# Altium project CountsFitness.PrjPCB (part 1 of 3)
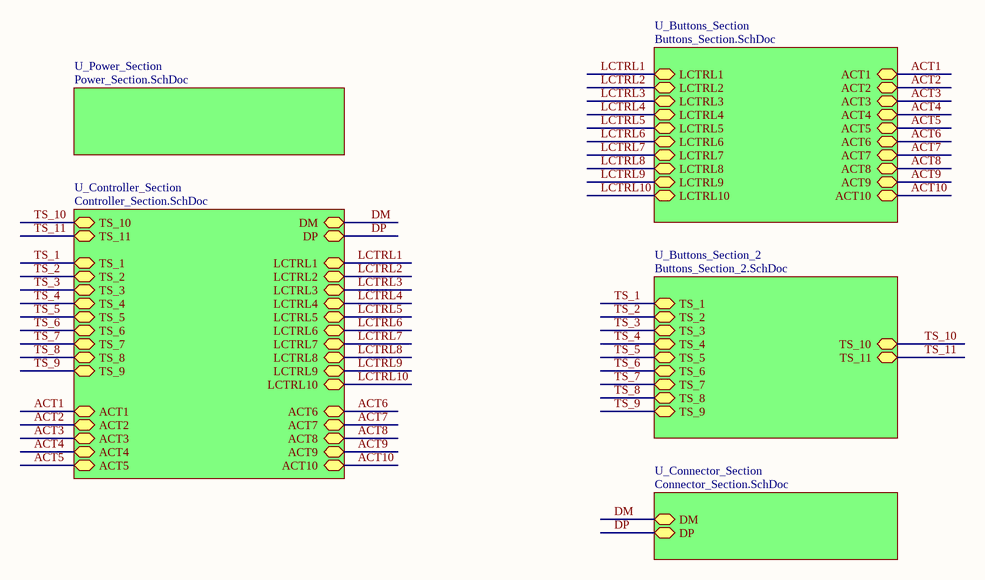
[diagram p0: Top Sheet.SchDoc]
6 sheets, 174 parts. Net scope: hierarchical (ports join the sheet entries above them; power ports are global).
Board file: Counts_PCB.PcbDoc
Sheets:
  Top Sheet.SchDoc
    U_Power_Section = Power_Section.SchDoc
    U_Controller_Section = Controller_Section.SchDoc
    U_Buttons_Section = Buttons_Section.SchDoc
    U_Connector_Section = Connector_Section.SchDoc
    U_Buttons_Section_2 = Buttons_Section_2.SchDoc

## Sheet Top Sheet.SchDoc
size A4; DocumentNumber: 1; SheetNumber: 1; SheetTotal: 6

### Sub-sheets
U_Buttons_Section = Buttons_Section.SchDoc: ACT9 (bidir), LCTRL8 (bidir), ACT4 (bidir), ACT3 (bidir), LCTRL5 (bidir), ACT2 (bidir), LCTRL4 (bidir), LCTRL7 (bidir), ACT6 (bidir), LCTRL2 (bidir), LCTRL6 (bidir), LCTRL9 (bidir), ACT1 (bidir), ACT8 (bidir), ACT7 (bidir), ACT10 (bidir), ACT5 (bidir), LCTRL3 (bidir), LCTRL1 (bidir), LCTRL10 (bidir)
U_Buttons_Section_2 = Buttons_Section_2.SchDoc: TS_6 (bidir), TS_8 (bidir), TS_9 (bidir), TS_5 (bidir), TS_2 (bidir), TS_7 (bidir), TS_4 (bidir), TS_1 (bidir), TS_3 (bidir), TS_10 (bidir), TS_11 (bidir)
U_Connector_Section = Connector_Section.SchDoc: DM (bidir), DP (bidir)
U_Controller_Section = Controller_Section.SchDoc: ACT6 (bidir), LCTRL5 (bidir), ACT10 (bidir), LCTRL1 (bidir), ACT8 (bidir), LCTRL4 (bidir), ACT5 (bidir), ACT9 (bidir), ACT1 (bidir), LCTRL2 (bidir), LCTRL6 (bidir), ACT3 (bidir), ACT2 (bidir), LCTRL3 (bidir), ACT4 (bidir), DM (bidir), DP (bidir), ACT7 (bidir), LCTRL7 (bidir), LCTRL10 (bidir), LCTRL9 (bidir), LCTRL8 (bidir), TS_8 (bidir), TS_7 (bidir), TS_9 (bidir), TS_6 (bidir), TS_5 (bidir), TS_4 (bidir), TS_3 (bidir), TS_2 (bidir), TS_1 (bidir), TS_10 (bidir), TS_11 (bidir)
U_Power_Section = Power_Section.SchDoc: no entries

### Nets
ACT1: sheet U_Controller_Section/ACT1, sheet U_Buttons_Section/ACT1
ACT2: sheet U_Controller_Section/ACT2, sheet U_Buttons_Section/ACT2
ACT3: sheet U_Controller_Section/ACT3, sheet U_Buttons_Section/ACT3
ACT4: sheet U_Controller_Section/ACT4, sheet U_Buttons_Section/ACT4
ACT5: sheet U_Controller_Section/ACT5, sheet U_Buttons_Section/ACT5
ACT6: sheet U_Controller_Section/ACT6, sheet U_Buttons_Section/ACT6
ACT7: sheet U_Controller_Section/ACT7, sheet U_Buttons_Section/ACT7
ACT8: sheet U_Controller_Section/ACT8, sheet U_Buttons_Section/ACT8
ACT9: sheet U_Controller_Section/ACT9, sheet U_Buttons_Section/ACT9
ACT10: sheet U_Controller_Section/ACT10, sheet U_Buttons_Section/ACT10
DM: sheet U_Controller_Section/DM, sheet U_Connector_Section/DM
DP: sheet U_Controller_Section/DP, sheet U_Connector_Section/DP
LCTRL1: sheet U_Controller_Section/LCTRL1, sheet U_Buttons_Section/LCTRL1
LCTRL2: sheet U_Controller_Section/LCTRL2, sheet U_Buttons_Section/LCTRL2
LCTRL3: sheet U_Controller_Section/LCTRL3, sheet U_Buttons_Section/LCTRL3
LCTRL4: sheet U_Controller_Section/LCTRL4, sheet U_Buttons_Section/LCTRL4
LCTRL5: sheet U_Controller_Section/LCTRL5, sheet U_Buttons_Section/LCTRL5
LCTRL6: sheet U_Controller_Section/LCTRL6, sheet U_Buttons_Section/LCTRL6
LCTRL7: sheet U_Controller_Section/LCTRL7, sheet U_Buttons_Section/LCTRL7
LCTRL8: sheet U_Controller_Section/LCTRL8, sheet U_Buttons_Section/LCTRL8
LCTRL9: sheet U_Controller_Section/LCTRL9, sheet U_Buttons_Section/LCTRL9
LCTRL10: sheet U_Controller_Section/LCTRL10, sheet U_Buttons_Section/LCTRL10
TS_1: sheet U_Controller_Section/TS_1, sheet U_Buttons_Section_2/TS_1
TS_2: sheet U_Controller_Section/TS_2, sheet U_Buttons_Section_2/TS_2
TS_3: sheet U_Controller_Section/TS_3, sheet U_Buttons_Section_2/TS_3
TS_4: sheet U_Controller_Section/TS_4, sheet U_Buttons_Section_2/TS_4
TS_5: sheet U_Controller_Section/TS_5, sheet U_Buttons_Section_2/TS_5
TS_6: sheet U_Controller_Section/TS_6, sheet U_Buttons_Section_2/TS_6
TS_7: sheet U_Controller_Section/TS_7, sheet U_Buttons_Section_2/TS_7
TS_8: sheet U_Controller_Section/TS_8, sheet U_Buttons_Section_2/TS_8
TS_9: sheet U_Controller_Section/TS_9, sheet U_Buttons_Section_2/TS_9
TS_10: sheet U_Controller_Section/TS_10, sheet U_Buttons_Section_2/TS_10
TS_11: sheet U_Controller_Section/TS_11, sheet U_Buttons_Section_2/TS_11

## Sheet Power_Section.SchDoc
size A4; DocumentNumber: 2; SheetNumber: 2; SheetTotal: 6
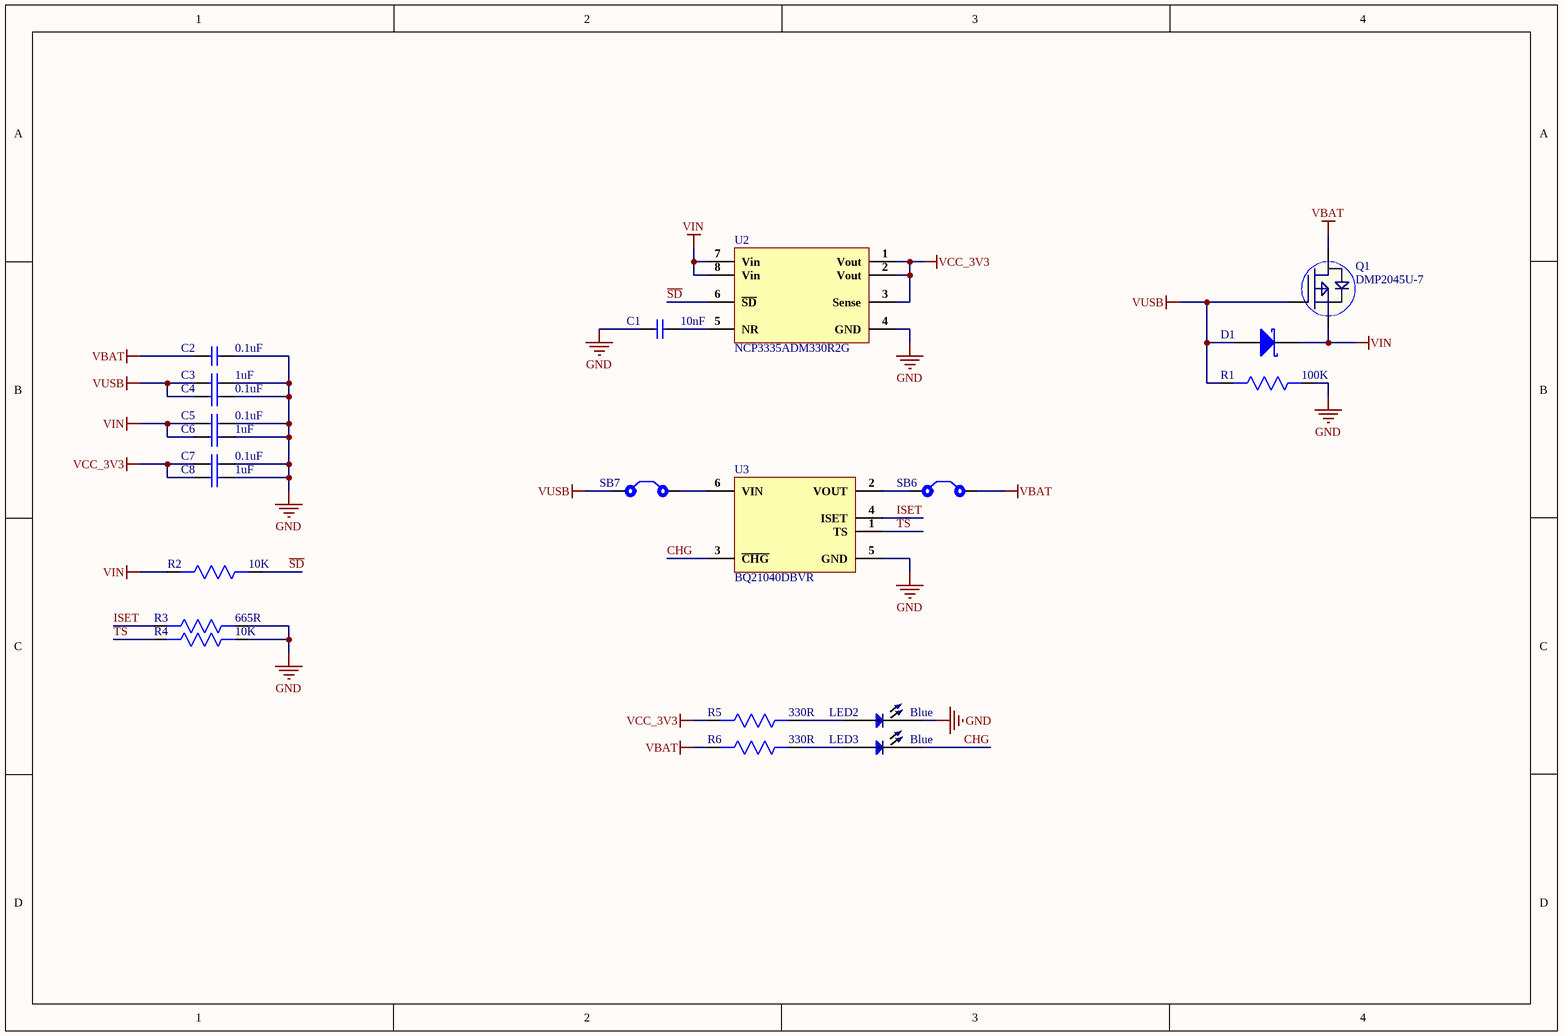
[diagram p1: Power_Section.SchDoc]

### Parts
C1  10nF  [Cap0402]
C2  0.1uF  [Cap0603]
C3  1uF  [Cap0603]
C4  0.1uF  [Cap0603]
C5  0.1uF  [Cap0402]
C6  1uF  [Cap0603]
C7  0.1uF  [Cap0402]
C8  1uF  [Cap0603]
D1  MBR120VLSFT3G  [MBR120VLSFT3G]  (value not drawn)
LED2  Blue  [LED 0603]
LED3  Blue  [LED 0603]
Q1  DMP2045U-7  [SOT23-3]
R1  100K  [Res0603]
R2  10K  [Res0402]
R3  665R  [Res0603]
R4  10K  [Res0402]
R5  330R  [Res0603]
R6  330R  [Res0603]
SB6  Solder Bridge  [Solder Bridge]  (value not drawn)
SB7  Solder Bridge  [Solder Bridge]  (value not drawn)
U2  NCP3335ADM330R2G  [NCP3335ADM330R2G]
U3  BQ21040DBVR  [BQ21040DBVR]

### Nets
GND: C1.1 C2.2 C3.2 C4.2 C5.2 C6.2 C7.2 C8.2 LED2.2 R1.1 R3.1 R4.1 U2.4(GND) U3.5(GND)
VBAT: C2.1 Q1.3(D) R6.2 SB6.2
VCC_3V3: C7.1 C8.1 R5.2 U2.1(Vout) U2.2(Vout) U2.3(Sense)
VIN: C5.1 C6.1 D1.2(K) Q1.2(S) R2.2 U2.7(Vin) U2.8(Vin)
VUSB: C3.1 C4.1 D1.1(A) Q1.1(G) R1.2 SB7.1
~{SD}: R2.1 U2.6(~{SD})
CHG: LED3.2 U3.3(~{CHG})
ISET: R3.2 U3.4(ISET)
TS: R4.2 U3.1(TS)
NetC1_2: C1.2 U2.5(NR)
NetLED2_1: LED2.1 R5.1
NetLED3_1: LED3.1 R6.1
NetSB6_1: SB6.1 U3.2(VOUT)
NetSB7_2: SB7.2 U3.6(VIN)

### Library data of the parts
C1 = CC0402KRX7R8BB103: CAP CER 10000PF 25V X7R 0402; Manufacturer: Yageo; Tolerance: 10%; Supplier 1: Digi-Key; Manufacturer Part Number: CC0402KRX7R8BB103; Stock 1: 0; Pricing 1: 1=0.1, 10=0.021, 100=0.0093, 500=0.00666, 1000=0.00523, 2500=0.00476, 5000=0.00438 (USD); Mount: Surface Mount; Case/Package: 0402; Case Code (Metric): 1005; Case Code (Imperial): 0402; Min Operating Temperature: -55°C; Max Operating Temperature: 125°C; Capacitance: 10nF; Dielectric: X7R; Voltage Rating: 25V; Package Quantity: 1; Packaging: Tape and Reel; Voltage Rating (DC): 25V; Termination: SMD/SMT; Composition: Ceramic; Length: 1mm; Height: 0.5mm; Depth: 0.5mm; Width: 0.02inch; Thickness: 0.022inch; Radiation Hardening: No; REACH SVHC: Unknown; Lead Free: Lead Free; Halogen Free: Halogen Free; ComponentLink1URL: http://www.yageo.com/documents/recent/UPY-GPHC_X7R_6.3V-to-50V_18.pdf?src-supplier=Digi-Key; ComponentLink1Description: http://www.yageo.com/documents/recent/UPY-GPHC_X7R_6.3V-to-50V_18.pdf?src-supplier=Digi-Key; ComponentLink2URL: https://www.verical.com/server-webapp/html/getDatasheet?partID=375418&src-supplier=Verical; ComponentLink2Description: https://www.verical.com/server-webapp/html/getDatasheet?partID=375418&src-supplier=Verical; ComponentLink3URL: http://www.yageo.com/documents/recent/UPY-GPHC_X7R_6.3V-to-50V_8.pdf?src-supplier=Avnet; ComponentLink3Description: http://www.yageo.com/documents/recent/UPY-GPHC_X7R_6.3V-to-50V_8.pdf?src-supplier=Avnet; ComponentLink4URL: https://4donline.ihs.com/images/VipMasterIC/IC/YAGO/YAGO-S-A0003557223/YAGO-S-A0003557223-1.pdf?hkey=52A5661711E402568146F3353EA87419&src-supplier=Element14; ComponentLink4Description: https://4donline.ihs.com/images/VipMasterIC/IC/YAGO/YAGO-S-A0003557223/YAGO-S-A0003557223-1.pdf?hkey=52A5661711E402568146F3353EA87419&src-supplier=Element14; ComponentLink5URL: http://www.farnell.com/datasheets/2167236.pdf?src-supplier=Element14; ComponentLink5Description: http://www.farnell.com/datasheets/2167236.pdf?src-supplier=Element14; ComponentLink6URL: http://www.mouser.com/ds/2/447/Yageo_UPY-GP_NP0_16V-to-50V_9-358835.pdf?src-supplier=Mouser; ComponentLink6Description: http://www.mouser.com/ds/2/447/Yageo_UPY-GP_NP0_16V-to-50V_9-358835.pdf?src-supplier=Mouser; Supplier Part Number 1: 311-1337-1-ND
C2 C4 = CC0603ZRY5V9BB104: CAP CER 0.1UF 50V Y5V 0603; Manufacturer: Yageo; Capacitance: 100nF; Tolerance: 80%; Supplier 1: Digi-Key; Manufacturer Part Number: CC0603ZRY5V9BB104; Stock 1: 15000880; Pricing 1: 1=0.1, 10=0.075, 100=0.0334, 500=0.02386, 1000=0.01874 (USD); Mount: Surface Mount; Case/Package: 0603; Number of Pins: 2; Case Code (Metric): 1608; Case Code (Imperial): 0603; Min Operating Temperature: -30°C; Max Operating Temperature: 85°C; Dielectric: Y5V; Voltage Rating: 50V; Package Quantity: 1; Packaging: Tape and Reel; Voltage Rating (DC): 50V; Termination: SMD/SMT; Composition: Ceramic; Voltage: 50V; Length: 1.6mm; Height: 0.8mm; Width: 0.031inch; Thickness: 0.035inch; Depth: 0.8mm; Radiation Hardening: No; REACH SVHC: No SVHC; Lead Free: Lead Free; Halogen Free: Halogen Free; ComponentLink1URL: http://www.yageo.com/documents/recent/UPY-GPHC_Y5V_6.3V-to-50V_8.pdf?src-supplier=Digi-Key; ComponentLink1Description: http://www.yageo.com/documents/recent/UPY-GPHC_Y5V_6.3V-to-50V_8.pdf?src-supplier=Digi-Key; ComponentLink2URL: http://www.yageo.com/documents/recent/UPY-GPHC_Y5V_6.3V-to-50V_5.pdf?src-supplier=Avnet+Europe; ComponentLink2Description: http://www.yageo.com/documents/recent/UPY-GPHC_Y5V_6.3V-to-50V_5.pdf?src-supplier=Avnet+Europe; ComponentLink3URL: https://www.verical.com/server-webapp/html/getDatasheet?partID=403611&src-supplier=Verical; ComponentLink3Description: https://www.verical.com/server-webapp/html/getDatasheet?partID=403611&src-supplier=Verical; ComponentLink4URL: http://www.mouser.com/ds/2/447/Yageo_UPY-GP_NP0_16V-to-50V_9-358835.pdf?src-supplier=Mouser; ComponentLink4Description: http://www.mouser.com/ds/2/447/Yageo_UPY-GP_NP0_16V-to-50V_9-358835.pdf?src-supplier=Mouser; ComponentLink5URL: http://www.farnell.com/datasheets/1132289.pdf?src-supplier=Element14; ComponentLink5Description: http://www.farnell.com/datasheets/1132289.pdf?src-supplier=Element14; Supplier Part Number 1: 311-1343-1-ND
C3 C6 C8 = UMK107AB7105KA-T: CAP CER 1UF 50V X7R 0603; Manufacturer: Taiyo Yuden; Tolerance: 10%; ComponentLink1URL: http://www.farnell.com/datasheets/2048165.pdf?src-supplier=Element14; ComponentLink1Description: http://www.farnell.com/datasheets/2048165.pdf?src-supplier=Element14; ComponentLink2URL: https://www.murata.com/~/media/webrenewal/support/library/catalog/products/capacitor/mlcc/c02e.ashx?la=en-us&src-supplier=Digi-Key; ComponentLink2Description: https://www.murata.com/~/media/webrenewal/support/library/catalog/products/capacitor/mlcc/c02e.ashx?la=en-us&src-supplier=Digi-Key; Supplier 1: Digi-Key; Manufacturer Part Number: UMK107AB7105KA-T; Stock 1: 453098; Pricing 1: 1=0.28, 10=0.19, 100=0.1079, 500=0.0762, 1000=0.0667 (USD); Mount: Surface Mount; Case/Package: 0603; Case Code (Metric): 1608; Case Code (Imperial): 0603; Min Operating Temperature: -55°C; Max Operating Temperature: 125°C; Packaging: Tape and Reel; Package Quantity: 1; Capacitance: 1uF; Voltage Rating: 50V; Voltage Rating (DC): 50V; Dielectric: X7R; Termination: SMD/SMT; Length: 1.6mm; Height: 0.8mm; Width: 0.031inch; Thickness: 0.037inch; Depth: 0.8mm; Radiation Hardening: No; Halogen Free: Halogen Free; ComponentLink3URL: https://www.yuden.co.jp/productdata/catalog/mlcc_all_e.pdf?src-supplier=Digi-Key; ComponentLink3Description: https://www.yuden.co.jp/productdata/catalog/mlcc_all_e.pdf?src-supplier=Digi-Key; ComponentLink4URL: https://www.yuden.co.jp/productdata/catalog/mlcc_all_e.pdf?src-supplier=Onlinecomponents.com; ComponentLink4Description: https://www.yuden.co.jp/productdata/catalog/mlcc_all_e.pdf?src-supplier=Onlinecomponents.com; Supplier Part Number 1: 587-3247-1-ND
C5 C7 = CC0402KRX7R7BB104: CAP CER 0.1UF 16V X7R 0402; Manufacturer: Yageo; Tolerance: 10%; Capacitance: 100nF; Supplier 1: Digi-Key; Manufacturer Part Number: CC0402KRX7R7BB104; Stock 1: 16982736; Pricing 1: 1=0.1, 10=0.034, 100=0.015, 500=0.0107, 1000=0.00841, 2500=0.00764, 5000=0.00703 (USD); Mount: Surface Mount; Case/Package: 0402; Number of Pins: 2; Case Code (Metric): 1005; Case Code (Imperial): 0402; Min Operating Temperature: -55°C; Max Operating Temperature: 125°C; Dielectric: X7R; Voltage Rating: 16V; Voltage Rating (DC): 16V; Packaging: Tape and Reel; Package Quantity: 1; Termination: SMD/SMT; Composition: Ceramic; Voltage: 16V; Length: 1mm; Height: 0.5mm; Width: 0.02inch; Thickness: 0.022inch; Depth: 0.5mm; Radiation Hardening: No; REACH SVHC: No SVHC; Lead Free: Lead Free; Halogen Free: Halogen Free; ComponentLink1URL: http://www.yageo.com/documents/recent/UPY-GPHC_X7R_6.3V-to-50V_8.pdf?src-supplier=Avnet+Europe; ComponentLink1Description: http://www.yageo.com/documents/recent/UPY-GPHC_X7R_6.3V-to-50V_8.pdf?src-supplier=Avnet+Europe; ComponentLink2URL: http://www.yageo.com/documents/recent/UPY-GPHC_X7R_6.3V-to-50V_18.pdf?src-supplier=Digi-Key; ComponentLink2Description: http://www.yageo.com/documents/recent/UPY-GPHC_X7R_6.3V-to-50V_18.pdf?src-supplier=Digi-Key; ComponentLink3URL: http://www.yageo.com/documents/recent/UPY-GPHC_X7R_6.3V-to-50V_8.pdf?src-supplier=Avnet; ComponentLink3Description: http://www.yageo.com/documents/recent/UPY-GPHC_X7R_6.3V-to-50V_8.pdf?src-supplier=Avnet; ComponentLink4URL: http://www.yageo.com/documents/recent/UPY-GPHC_X7R_6.3V-to-50V_18.pdf?src-supplier=Mouser; ComponentLink4Description: http://www.yageo.com/documents/recent/UPY-GPHC_X7R_6.3V-to-50V_18.pdf?src-supplier=Mouser; ComponentLink5URL: http://www.farnell.com/datasheets/2167236.pdf?src-supplier=Element14; ComponentLink5Description: http://www.farnell.com/datasheets/2167236.pdf?src-supplier=Element14; ComponentLink6URL: http://www.farnell.com/datasheets/1489800.pdf?src-supplier=Element14; ComponentLink6Description: http://www.farnell.com/datasheets/1489800.pdf?src-supplier=Element14; Supplier Part Number 1: 311-1338-1-ND
D1 = MBR120VLSFT3G: DIODE SCHOTTKY 20V 1A SOD123FL; Manufacturer: ON Semiconductor; Max Surge Current: 45A; Forward Voltage: 340mV; Peak Reverse Current: 600uA; Element Configuration: Single; Polarity: Standard; Supplier 1: Digi-Key; Manufacturer Part Number: MBR120VLSFT3G; Stock 1: 130499; Pricing 1: 1=0.42, 10=0.338, 100=0.2298, 500=0.17234, 1000=0.12926 (USD); Number of Pins: 2; Min Operating Temperature: -65°C; Max Operating Temperature: 125°C; Package Quantity: 10000; Forward Current: 1A; Packaging: Tape and Reel; Max Reverse Leakage Current: 600uA; Average Rectified Current: 1A; Peak Non-Repetitive Surge Current: 45A; Max Repetitive Reverse Voltage (Vrrm): 20V; Max Forward Surge Current (Ifsm): 45A; Voltage Rating (DC): 20V; Current Rating: 1A; Output Current: 1A; Max Reverse Voltage (DC): 20V; Radiation Hardening: No; REACH SVHC: No SVHC; Lead Free: Lead Free; Halogen Free: Halogen Free; ComponentLink1URL: http://www.mouser.com/ds/2/308/MBR120VLSFT1-D-107081.pdf?src-supplier=Mouser; ComponentLink1Description: http://www.mouser.com/ds/2/308/MBR120VLSFT1-D-107081.pdf?src-supplier=Mouser; ComponentLink2URL: http://www.onsemi.com/pub/Collateral/MBR120VLSFT1-D.PDF?src-supplier=Digi-Key; ComponentLink2Description: http://www.onsemi.com/pub/Collateral/MBR120VLSFT1-D.PDF?src-supplier=Digi-Key; ComponentLink3URL: http://www.onsemi.cn/pub_link/Collateral/MBR120VLSFT1-D.PDF?src-supplier=Avnet; ComponentLink3Description: http://www.onsemi.cn/pub_link/Collateral/MBR120VLSFT1-D.PDF?src-supplier=Avnet; Supplier Part Number 1: MBR120VLSFT3GOSCT-ND
LED2 LED3 = APT1608QBC/D: LED BLUE CLEAR CHIP SMD; Manufacturer: Kingbright; Lens Color: Clear,Colorless; Luminous Intensity: 100mcd; Viewing Angle: 120°; Lens Style: Clear,Flat; Forward Current: 20mA; Forward Voltage: 3.3V; Dominant Wavelength: 465nm; Number of LEDs: 1; Supplier 1: Digi-Key; Manufacturer Part Number: APT1608QBC/D; Stock 1: 106851; Pricing 1: 1=0.49, 10=0.35, 25=0.286, 100=0.2288, 250=0.19304, 500=0.16446, 1000=0.1287 (USD); Mount: Surface Mount; Case/Package: 0603; Number of Pins: 2; Color: Blue; Case Code (Metric): 1608; Case Code (Imperial): 0603; Min Operating Temperature: -40°C; Max Operating Temperature: 85°C; Package Quantity: 2000; Packaging: Tape and Reel; Illumination Color: Blue; Lens Transparency: Clear; Test Current: 20mA; Length: 1.6mm; Height: 0.75mm; Width: 0.8mm; Lead Free: Lead Free; ComponentLink1URL: http://www.kingbrightusa.com/images/catalog/SPEC/APT1608QBC-D.pdf?src-supplier=Digi-Key; ComponentLink1Description: http://www.kingbrightusa.com/images/catalog/SPEC/APT1608QBC-D.pdf?src-supplier=Digi-Key; ComponentLink2URL: http://www.mouser.com/ds/2/216/APT1608QBC-D-65281.pdf?src-supplier=Mouser; ComponentLink2Description: http://www.mouser.com/ds/2/216/APT1608QBC-D-65281.pdf?src-supplier=Mouser; Supplier Part Number 1: 754-1434-1-ND
Q1 = DMP2045U-7: MOSFET P-CHAN 24V SOT23
R1 = RT0603BRD07100KL: RES SMD 100K OHM 0.1% 1/10W 0603; Manufacturer: Yageo; Resistance: 100kR; Temperature Coefficient: 25ppm/°C; Voltage Rating (DC): 75V; Power Rating: 100mW; Supplier 1: Digi-Key; Manufacturer Part Number: RT0603BRD07100KL; Stock 1: 53395; Pricing 1: 1=0.39, 10=0.332, 100=0.1298, 1000=0.05435, 2500=0.04982 (USD); Mount: Surface Mount; Case/Package: 0603; Case Code (Imperial): 0603; Case Code (Metric): 1608; Min Operating Temperature: -55°C; Max Operating Temperature: 125°C; Tolerance: 0.1%; Composition: Thin Film; Packaging: Tape and Reel; Voltage Rating: 75V; Package Quantity: 5000; Termination: SMD/SMT; Number of Terminations: 2; Military Standard: Not; Max Power Dissipation: 100mW; Working Voltage: 75V; Features: Moisture Resistant; Length: 1.6mm; Height: 0.022inch; Width: 0.031inch; Depth: 0.8mm; Lead Free: Lead Free; ComponentLink1URL: http://documents.rs-components.com/techlib://itc_doclist_GB.htm?stockno=6174810&src-supplier=RSComponents; ComponentLink1Description: http://documents.rs-components.com/techlib://itc_doclist_GB.htm?stockno=6174810&src-supplier=RSComponents; Supplier Part Number 1: YAG1235CT-ND
R2 R4 = RK73B1ETTP103J: RES 10K OHM 5% 1/10W 0402; Manufacturer: KOA Speer; Resistance: 10kR; Power Rating: 63mW; Voltage Rating: 50V; Temperature Coefficient: 200ppm/°C; Supplier 1: Digi-Key; Manufacturer Part Number: RK73B1ETTP103J; Stock 1: 2917894; Pricing 1: 1=0.1, 10=0.016, 100=0.0065, 1000=0.00292, 2500=0.00253, 5000=0.00209 (USD); Mount: Surface Mount; Case/Package: 0402; Case Code (Imperial): 0402; Case Code (Metric): 1005; Min Operating Temperature: -55°C; Max Operating Temperature: 155°C; Packaging: Tape and Reel; Tolerance: 5%; Package Quantity: 10000; Composition: Thick Film; Termination: SMD/SMT; Military Standard: Not; Voltage Rating (DC): 50V; Length: 1mm; Height: 0.35mm; Width: 0.5mm; Depth: 0.5mm; Lead Free: Lead Free; ComponentLink1URL: https://www.verical.com/server-webapp/html/getDatasheet?partID=89073&src-supplier=Verical; ComponentLink1Description: https://www.verical.com/server-webapp/html/getDatasheet?partID=89073&src-supplier=Verical; Supplier Part Number 1: 2019-RK73B1ETTP103JCT-ND
R3 = RC0603FR-07665RL: RES SMD 665 OHM 1% 1/10W 0603; Manufacturer: Yageo; Temperature Coefficient: 100ppm/°C; Power Rating: 100mW; Voltage Rating: 75V; Voltage Rating (DC): 50V; Supplier 1: Digi-Key; Manufacturer Part Number: RC0603FR-07665RL; Stock 1: 92350; Pricing 1: 1=0.1, 10=0.022, 100=0.009, 1000=0.00405, 2500=0.00352 (USD); Case/Package: 0603; Weight: 7.1E-05oz; Contact Plating: Tin,Matte; Case Code (Imperial): 0603; Case Code (Metric): 1608; Min Operating Temperature: -55°C; Max Operating Temperature: 155°C; Resistance: 665R; Tolerance: 1%; Resistor Type: Thick Film; Packaging: Tape and Reel; Package Quantity: 1; Termination: SMD/SMT; Number of Terminations: 2; Max Power Dissipation: 100mW; Features: Moisture Resistant; Length: 1.6mm; Height: 0.022inch; Width: 0.8mm; Depth: 0.8mm; Military Standard: Not; Lead Free: Lead Free; ComponentLink1URL: http://www.yageo.com/documents/recent/PYu-RC_Group_51_RoHS_L_9.pdf?src-supplier=Digi-Key; ComponentLink1Description: http://www.yageo.com/documents/recent/PYu-RC_Group_51_RoHS_L_9.pdf?src-supplier=Digi-Key; ComponentLink2URL: http://www.yageo.com/documents/recent/PYu-RC0603_51_RoHS_L_4.pdf?src-supplier=Avnet; ComponentLink2Description: http://www.yageo.com/documents/recent/PYu-RC0603_51_RoHS_L_4.pdf?src-supplier=Avnet; ComponentLink3URL: http://www.yageo.com/documents/recent/PYu-RC_Group_51_RoHS_L_10.pdf?src-supplier=Digi-Key; ComponentLink3Description: http://www.yageo.com/documents/recent/PYu-RC_Group_51_RoHS_L_10.pdf?src-supplier=Digi-Key; ComponentLink4URL: http://www.yageo.com/documents/recent/PYu-RC0603_51_RoHS_L_4.pdf?src-supplier=Avnet+Europe; ComponentLink4Description: http://www.yageo.com/documents/recent/PYu-RC0603_51_RoHS_L_4.pdf?src-supplier=Avnet+Europe; Supplier Part Number 1: 311-665HRCT-ND
R5 R6 = RC0603FR-07330RL: RES SMD 330 OHM 1% 1/10W 0603; Manufacturer: Yageo; Temperature Coefficient: 100ppm/°C; Voltage Rating (DC): 50V; Power Rating: 100mW; Supplier 1: Digi-Key; Manufacturer Part Number: RC0603FR-07330RL; Stock 1: 9084897; Pricing 1: 1=0.1, 10=0.024, 100=0.0097, 1000=0.00437, 2500=0.00379 (USD); Case/Package: 0603; Number of Pins: 2; Case Code (Metric): 1608; Case Code (Imperial): 0603; Min Operating Temperature: -55°C; Max Operating Temperature: 155°C; Resistance: 330R; Tolerance: 1%; Composition: Thick Film; Packaging: Tape and Reel; Voltage Rating: 50V; Package Quantity: 1; Number of Terminations: 2; Termination: SMD/SMT; Max Power Dissipation: 100mW; Features: Moisture Resistant; Length: 1.6mm; Height: 0.45mm; Width: 0.8mm; Depth: 0.8mm; REACH SVHC: No SVHC; Lead Free: Lead Free; ComponentLink1URL: http://www.yageo.com/documents/recent/PYu-RC_Group_51_RoHS_L_10.pdf?src-supplier=Digi-Key; ComponentLink1Description: http://www.yageo.com/documents/recent/PYu-RC_Group_51_RoHS_L_10.pdf?src-supplier=Digi-Key; ComponentLink2URL: http://www.farnell.com/datasheets/2167052.pdf?src-supplier=Mouser; ComponentLink2Description: http://www.farnell.com/datasheets/2167052.pdf?src-supplier=Mouser; ComponentLink3URL: http://www.farnell.com/datasheets/1868787.pdf?src-supplier=Element14; ComponentLink3Description: http://www.farnell.com/datasheets/1868787.pdf?src-supplier=Element14; ComponentLink4URL: http://www.farnell.com/datasheets/443971.pdf?src-supplier=Element14; ComponentLink4Description: http://www.farnell.com/datasheets/443971.pdf?src-supplier=Element14; ComponentLink5URL: http://www.farnell.com/datasheets/1686128.pdf?src-supplier=Element14; ComponentLink5Description: http://www.farnell.com/datasheets/1686128.pdf?src-supplier=Element14; ComponentLink6URL: http://documents.rs-components.com/techlib://itc_doclist_GB.htm?stockno=5046499&src-supplier=RSComponents; ComponentLink6Description: http://documents.rs-components.com/techlib://itc_doclist_GB.htm?stockno=5046499&src-supplier=RSComponents; Supplier Part Number 1: 311-330HRCT-ND
SB6 SB7 = Solder Bridge: Solder Bridge ON
U2 = NCP3335ADM330R2G: IC REG LINEAR 3.3V 500MA MICRO8; Manufacturer: ON Semiconductor; Min Input Voltage: 2.6V; Max Input Voltage: 16V; Number of Outputs: 1; Max Output Current: 800mA; Polarity: Positive; Accuracy: 0.9%; Output Type: Fixed; Dropout Voltage: 340mV; Reference Voltage: 1.269V; Supplier 1: Digi-Key; Manufacturer Part Number: NCP3335ADM330R2G; Stock 1: 2299; Pricing 1: 1=1.12, 10=1.003, 25=0.952, 100=0.731, 250=0.646, 500=0.612, 1000=0.476 (USD); Mount: Surface Mount; Case/Package: MSOP; Number of Pins: 8; Min Operating Temperature: -40°C; Max Operating Temperature: 150°C; Output Voltage: 3.3V; Package Quantity: 4000; Output Current: 800mA; Packaging: Tape and Reel; Number of Regulators: 1; Min Output Voltage: 3.3V; Output Voltage Accuracy: 0.9%; Length: 3.1mm; Height: 0.95mm; Width: 3.1mm; Radiation Hardening: No; Lead Free: Lead Free; Halogen Free: Halogen Free; ComponentLink1URL: http://www.onsemi.com/pub_link/Collateral/NCP3335A-D.PDF?src-supplier=Future+Electronics; ComponentLink1Description: http://www.onsemi.com/pub_link/Collateral/NCP3335A-D.PDF?src-supplier=Future+Electronics; ComponentLink2URL: http://www.onsemi.com/pub/Collateral/NCP3335A-D.PDF?src-supplier=Digi-Key; ComponentLink2Description: http://www.onsemi.com/pub/Collateral/NCP3335A-D.PDF?src-supplier=Digi-Key; Supplier Part Number 1: NCP3335ADM330R2GOSCT-ND
U3 = BQ21040DBVR: IC BAT CHG LI-ION 1 CELL SOT23-6; Manufacturer: Texas Instruments; Number of Cells: 1; Supplier 1: Digi-Key; Manufacturer Part Number: BQ21040DBVR; Stock 1: 10857; Pricing 1: 1=1.14, 10=1.015, 100=0.7912, 500=0.65364, 1000=0.51603 (USD); Lead Free: Lead Free; Supplier Part Number 1: 296-47315-1-ND